# Altium project PCB_Project.PrjPcb (part 2 of 8)
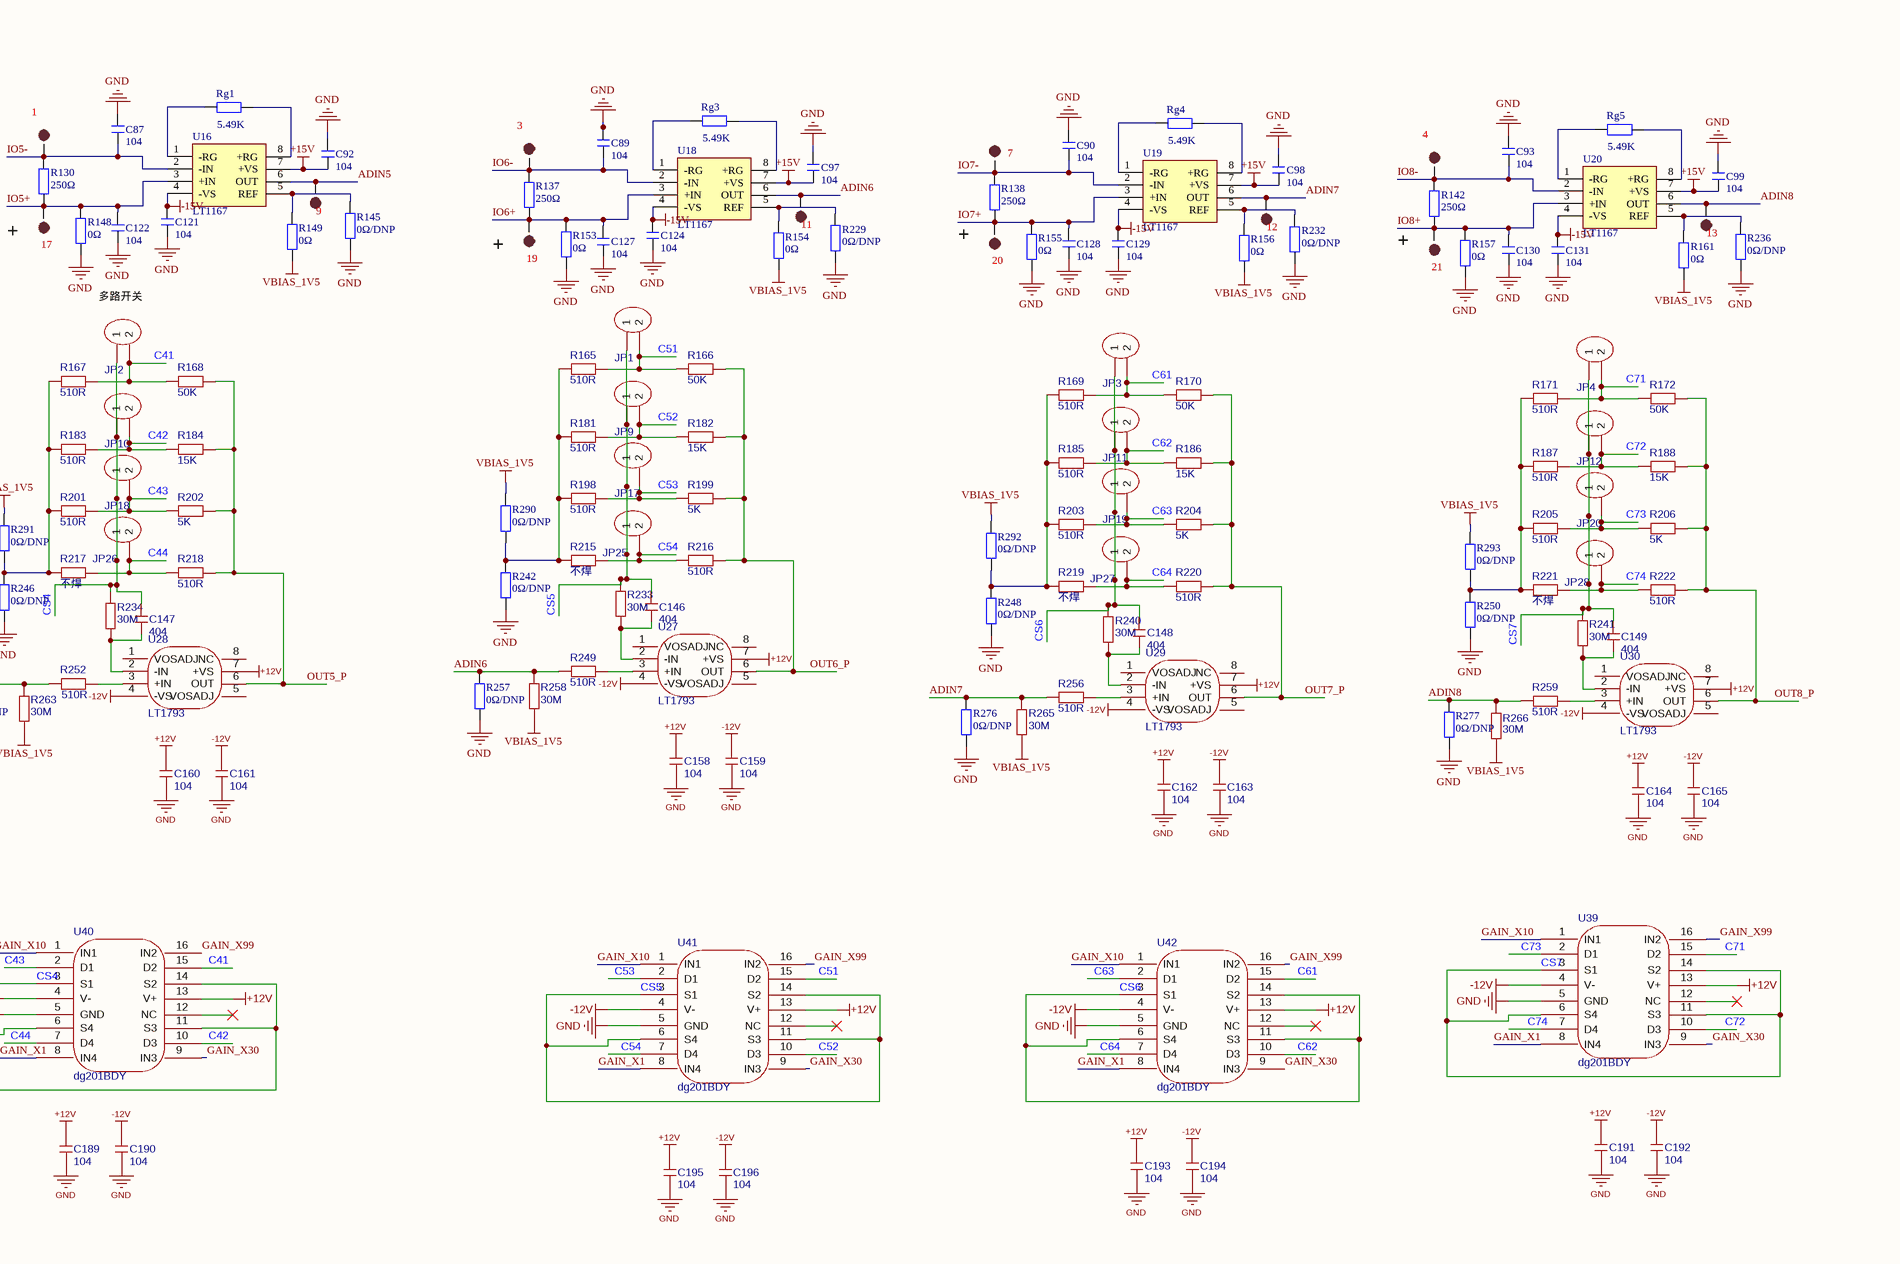
[diagram p6: DSP大板子.SchDoc, bottom right]